# Altium schematic sheet primer_kontrol.SchDoc
size A4
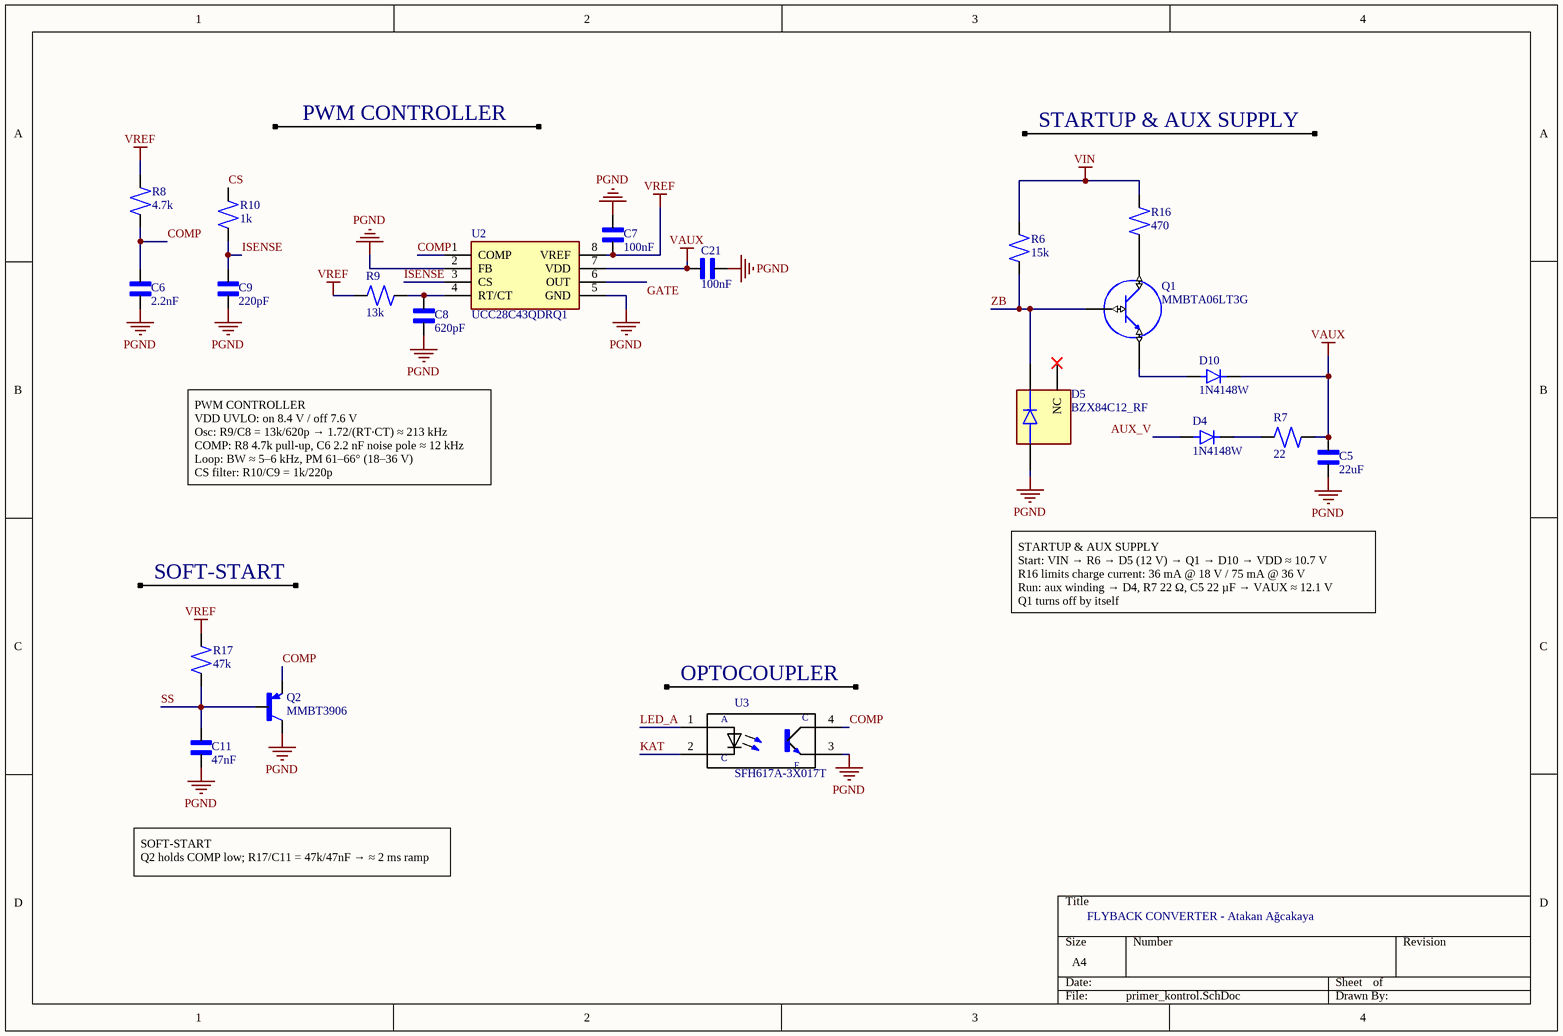
[diagram p0: primer_kontrol.SchDoc]

## Parts
C5  22uF  [CAPC3225X280N]
C6  2.2nF  [CAPC2012X145N]
C7  100nF  [CAPC2012X145N]
C8  620pF  [CAPC2012X145N]
C9  220pF  [CAPC2012X145N]
C11  47nF  [CAPC2012X145N]
C21  100nF  [CAPC2012X145N]
D4  1N4148W  [SODFL3816X120N]
D5  BZX84C12_RF  [SOT95P237X112-3N]
D10  1N4148W  [SODFL3816X120N]
Q1  MMBTA06LT3G  [SOT-23]
Q2  MMBT3906  [SOT95P260X140-3N]
R6  15k  [RESC2012X60N]
R7  22  [RESC2012X60N]
R8  4.7k  [RESC2012X60N]
R9  13k  [RESC2012X60N]
R10  1k  [RESC2012X60N]
R16  470  [RESC3216X65N]
R17  47k  [RESC2012X60N]
U2  UCC28C43QDRQ1  [SOIC127P600X175-8N]
U3  SFH617A-3X017T  [*SOIC254P1016X360-4N]

## Nets
PGND: C5.1 C6.1 C7.1 C8.1 C9.1 C11.1 C21.1 D5.1(A) Q2.3(C) U2.2(FB) U2.5(GND) U3.3(E)
VAUX: C5.2 C21.2 D10.C(K) R7.1 U2.7(VDD)
VIN: R6.2 R16.2
VREF: C7.2 R8.2 R9.2 R17.2 U2.8(VREF)
AUX_V: D4.A
COMP: C6.2 Q2.2(E) R8.1 U2.1(COMP) U3.4(CO)
CS: R10.2
GATE: U2.6(OUT)
ISENSE: C9.2 R10.1 U2.3(CS)
KAT: U3.2(C)
LED_A: U3.1(A)
SS: C11.2 Q2.1(B) R17.1
ZB: D5.3(K) Q1.BASE R6.1
NetC8_2: C8.2 R9.1 U2.4(RT/CT)
NetD4_C: D4.C(K) R7.2
NetD10_A: D10.A Q1.EMITTER
NetQ1_COLLECTOR: Q1.COLLECTOR R16.1

Not connected (* = marked no-connect by the designer): D5 2(NC)*

## Notes on the sheet
- PWM CONTROLLER
- STARTUP & AUX SUPPLY
- PWM CONTROLLER
  VDD UVLO: on 8.4 V / off 7.6 V
  Osc: R9/C8 = 13k/620p → 1.72/(RT·CT) ≈ 213 kHz
  COMP: R8 4.7k pull-up, C6 2.2 nF noise pole ≈ 12 kHz
  Loop: BW ≈ 5–6 kHz, PM 61–66° (18–36 V)
  CS filter: R10/C9 = 1k/220p
- SOFT-START
- STARTUP & AUX SUPPLY
  Start: VIN → R6 → D5 (12 V) → Q1 → D10 → VDD ≈ 10.7 V
  R16 limits charge current: 36 mA @ 18 V / 75 mA @ 36 V
  Run: aux winding → D4, R7 22 Ω, C5 22 µF → VAUX ≈ 12.1 V
  Q1 turns off by itself
- (near U3) OPTOCOUPLER
- SOFT-START
  Q2 holds COMP low; R17/C11 = 47k/47nF → ≈ 2 ms ramp
- FLYBACK CONVERTER - Atakan Ağcakaya

## Library data of the parts
C5 = C_1210: 22µF, 25V, X7R; Value: 22uF
C6-C9 C11 C21 = C_0805
  C6: Value: 2.2nF
  C7 C21: Value: 100nF
  C8: Value: 620pF
  C9: Value: 220pF
  C11: Value: 47nF
D4 D10 = 1N4148W: Small Signal Diode, SOD-123F, 100V, 0.15A, 150Â°C; MF: Diotec Semiconductor; SnapEDA_Link: https://www.snapeda.com/parts/1N4148W/Diotec/view-part/?ref=snap; Package: SOD-123F Diotec; Value: *; MP: 1N4148W; Check_prices: https://www.snapeda.com/parts/1N4148W/Diotec/view-part/?ref=eda
D5 = BZX84C12_RF: MF: {'manufacturer': u'Taiwan Semiconductor'}; MP: BZX84C12 RFG; Package: None; Price: None; Value: *; Availability: Unavailable
Q1 = MMBTA06LT3G: Bipolar (BJT) Transistor NPN 80 V 500 mA 100MHz 225 mW Surface Mount SOT-23-3 (TO-236); MF: ON Semiconductor; SnapEDA_Link: https://www.snapeda.com/parts/MMBTA06LT3G/Onsemi/view-part/?ref=snap; Package: SOT-23-3 ON Semiconductor; Value: *; MP: MMBTA06LT3G; Check_prices: https://www.snapeda.com/parts/MMBTA06LT3G/Onsemi/view-part/?ref=eda
Q2 = MMBT3906: Bipolar (BJT) Transistor PNP 40 V 200 mA 300MHz 200 mW Surface Mount SOT-23; MF: MDD; SnapEDA_Link: https://www.snapeda.com/parts/MMBT3906/MDD/view-part/?ref=snap; Package: None; Value: *; MP: MMBT3906; Check_prices: https://www.snapeda.com/parts/MMBT3906/MDD/view-part/?ref=eda
R6-R10 R17 = R_0805
  R6: Value: 15k
  R7: Value: 22
  R8: Value: 4.7k
  R9: Value: 13k
  R10: Value: 1k
  R17: Value: 47k
R16 = R_1206: Panasonic ERJ-P08J471V; Value: 470
U2 = UCC28C43QDRQ1: Automotive BiCMOS Low-Power Current-Mode PWM Controller; Manufacturer_Name: Texas Instruments; Geometry.Height: 1.75mm; Manufacturer_Part_Number: UCC28C43QDRQ1; Mouser Part Number: 595-UCC28C43QDRQ1; Mouser Price/Stock: https://www.mouser.co.uk/ProductDetail/Texas-Instruments/UCC28C43QDRQ1?qs=xhbEVWpZdWdYUtf6Fj0SHg%3D%3D; Arrow Part Number: UCC28C43QDRQ1; Arrow Price/Stock: https://www.arrow.com/en/products/ucc28c43qdrq1/texas-instruments.html?utm_currency=USD&region=nac; Datasheet Link: http://www.ti.com/lit/gpn/ucc28c43-q1
U3 = SFH617A-3X017T: MANUFACTURER: VISHAY; SOURCE_URL: https://www.snapeda.com/parts/SFH617A-3X017/Vishay/view-part/?ref=snap; Value: *